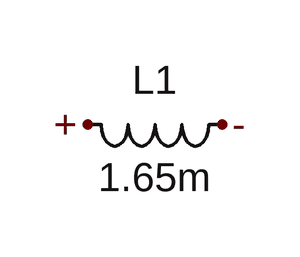
[diagram p0: schematic coil.asc]
coil.asc, the LTspice schematic file:
Version 4
SHEET 1 880 680
FLAG 128 160 +
FLAG 208 160 -
SYMBOL ind 224 144 R90
WINDOW 0 5 56 VBottom 2
WINDOW 3 32 56 VTop 2
SYMATTR InstName L1
SYMATTR Value 1.65m
SYMATTR SpiceLine Rser=0.23

The netlist it stands for:
* coil.asc
L1 - + 1.65m Rser=0.23
.backanno
.end